# EAGLE design audioDiffPairRev7.0 (EAGLE 9.6.2)
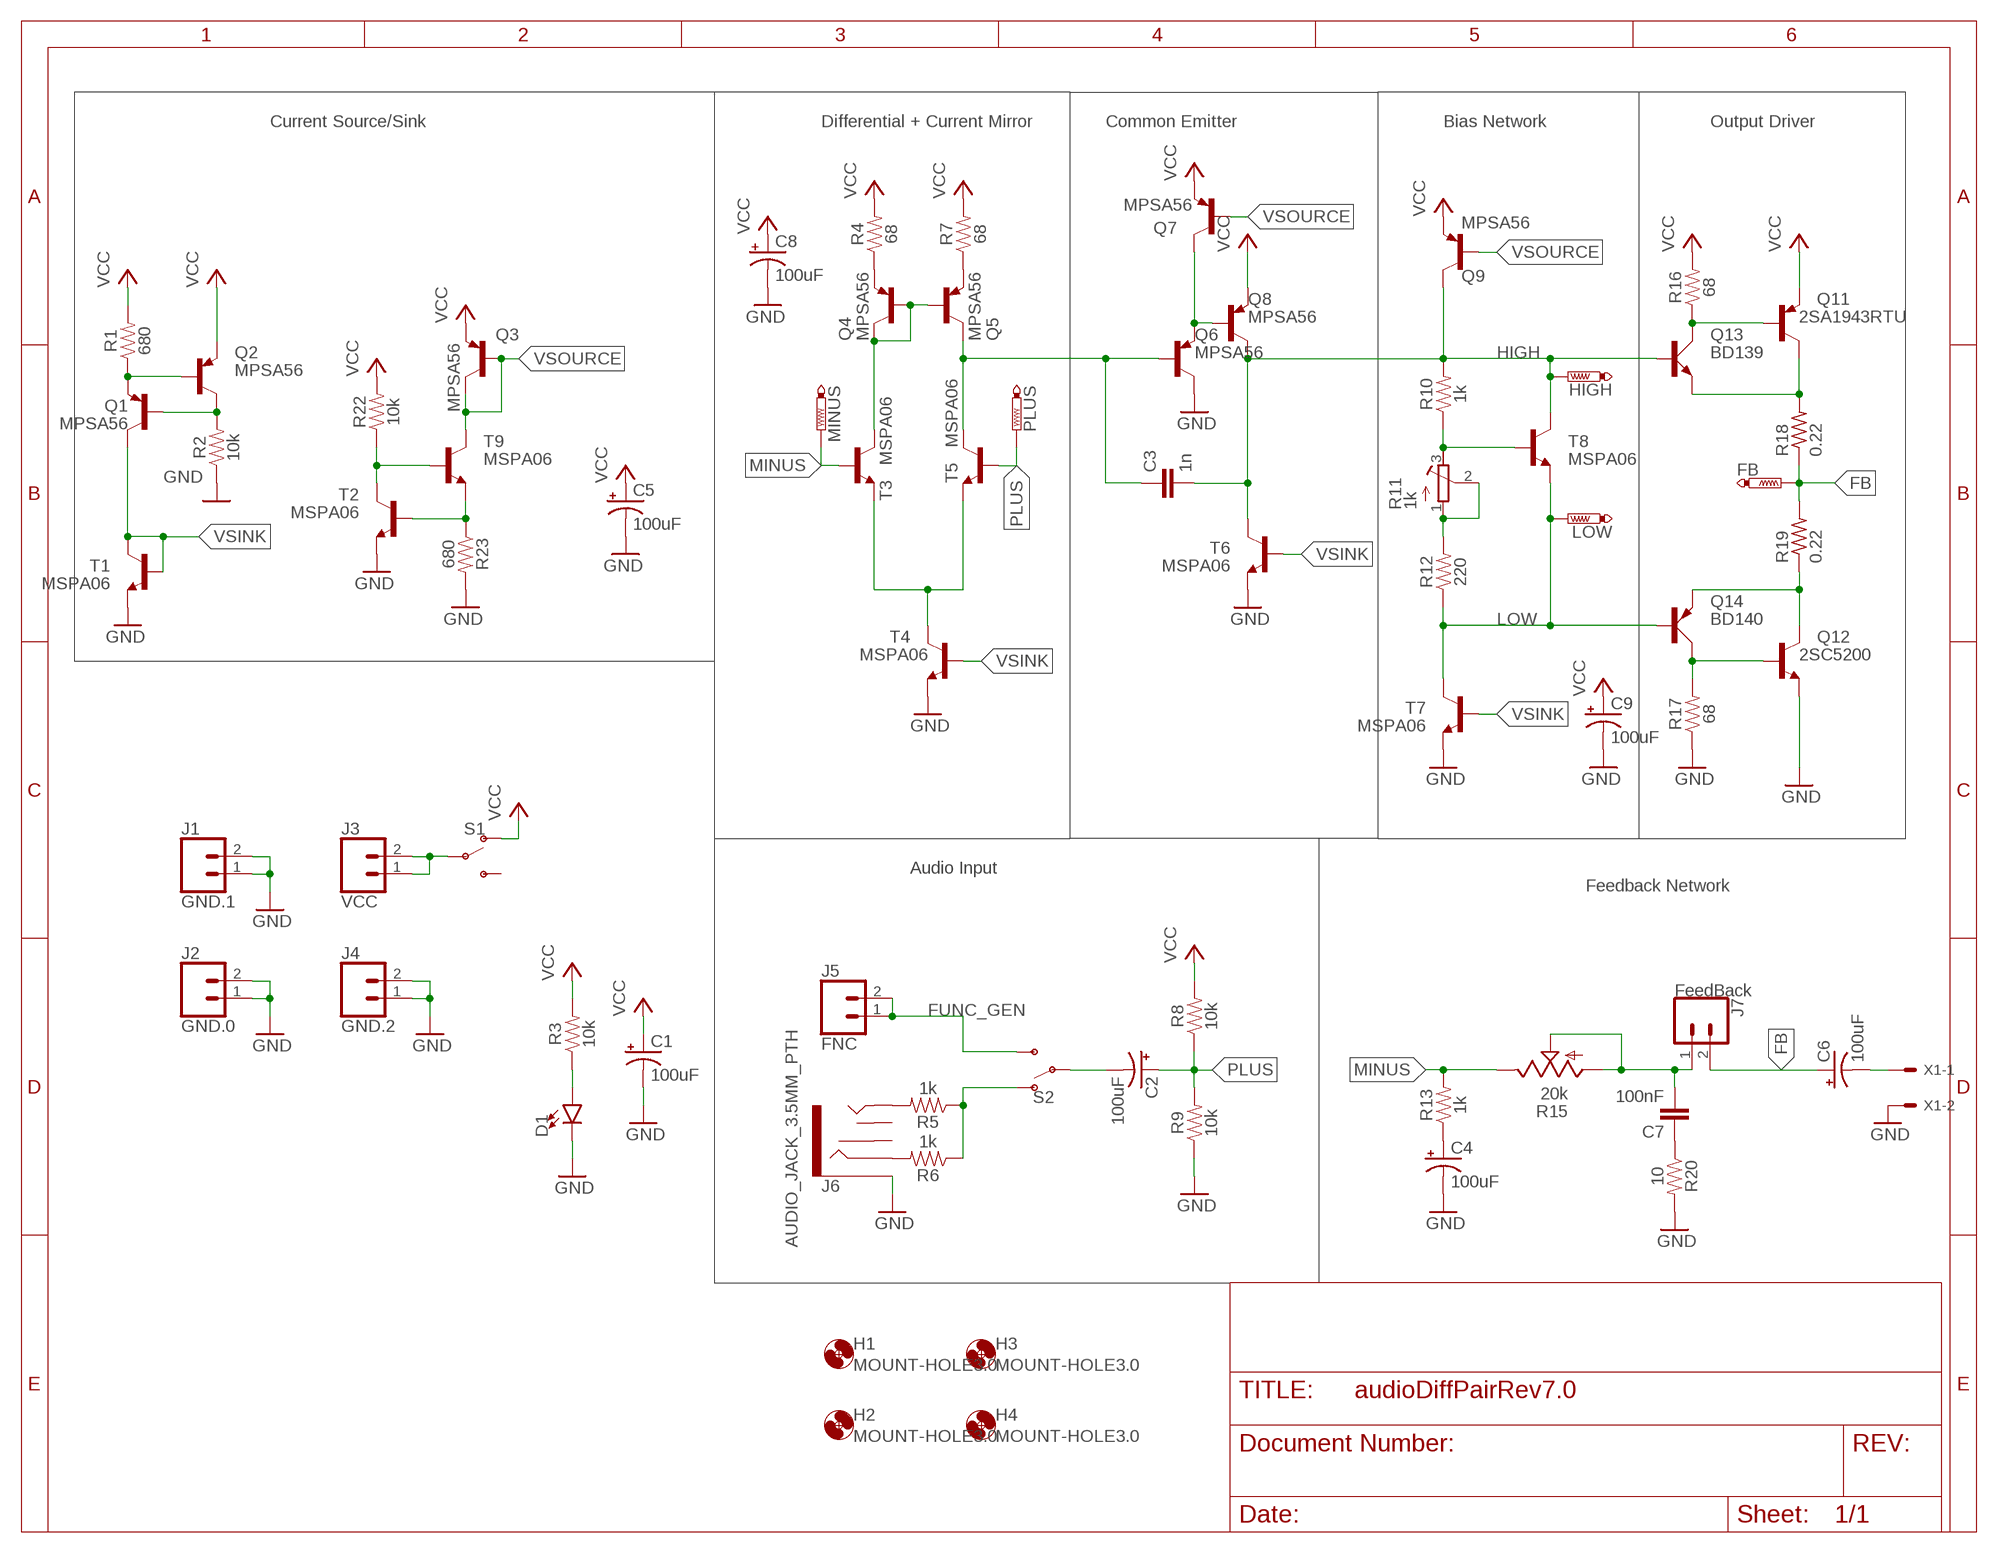
[diagram p0: schematic, sheet 1]

## Parts
C1  100uF  100UF-POLAR-RADIAL-2.5MM-25V-20%  [CPOL-RADIAL-2.5MM-6.5MM]
C2  100uF  100UF-POLAR-RADIAL-2.5MM-25V-20%  [CPOL-RADIAL-2.5MM-6.5MM]
C3  1n  C-EU025-025X050  [C025-025X050]
C4  100uF  100UF-POLAR-RADIAL-2.5MM-25V-20%  [CPOL-RADIAL-2.5MM-6.5MM]
C5  100uF  100UF-POLAR-RADIAL-2.5MM-25V-20%  [CPOL-RADIAL-2.5MM-6.5MM]
C6  100uF  100UF-POLAR-RADIAL-2.5MM-25V-20%  [CPOL-RADIAL-2.5MM-6.5MM]
C7  100nF  C-EU025-025X050  [C025-025X050]
C8  100uF  100UF-POLAR-RADIAL-2.5MM-25V-20%  [CPOL-RADIAL-2.5MM-6.5MM]
C9  100uF  100UF-POLAR-RADIAL-2.5MM-25V-20%  [CPOL-RADIAL-2.5MM-6.5MM]
D1  LED5MM  [LED_5MM]
FB  PTR1PAD1-13Y  [P1-13Y]
H1  MOUNT-HOLE3.0  [3,0]
H2  MOUNT-HOLE3.0  [3,0]
H3  MOUNT-HOLE3.0  [3,0]
H4  MOUNT-HOLE3.0  [3,0]
HIGH  PTR1PAD1-13Y  [P1-13Y]
J1  GND.1  CONN_02LOCK_LONGPADS  [1X02_LOCK_LONGPADS]
J2  GND.0  CONN_02LOCK_LONGPADS  [1X02_LOCK_LONGPADS]
J3  VCC  CONN_02LOCK_LONGPADS  [1X02_LOCK_LONGPADS]
J4  GND.2  CONN_02LOCK_LONGPADS  [1X02_LOCK_LONGPADS]
J5  FNC  CONN_02LOCK_LONGPADS  [1X02_LOCK_LONGPADS]
J6  AUDIO_JACK_3.5MM_PTH  [AUDIO-JACK]
J7  FeedBack  CONN_02LOCK_LONGPADS  [1X02_LOCK_LONGPADS]
LOW  PTR1PAD1-13Y  [P1-13Y]
MINUS  PTR1PAD1-13Y  [P1-13Y]
PLUS  PTR1PAD1-13Y  [P1-13Y]
Q1  MPSA56  [TO92-CBE]
Q2  MPSA56  [TO92-CBE]
Q3  MPSA56  [TO92-CBE]
Q4  MPSA56  [TO92-CBE]
Q5  MPSA56  [TO92-CBE]
Q6  MPSA56  [TO92-CBE]
Q7  MPSA56  [TO92-CBE]
Q8  MPSA56  [TO92-CBE]
Q9  MPSA56  [TO92-CBE]
Q11  2SA1943RTU  [TO545P2000X500X2900-3]
Q12  2SC5200  [TO545P2020X520X2910-3]
Q13  BD139  [TO126AV]
Q14  BD140  [TO126AV]
R1  680  RESISTORAXIAL-0.3  [AXIAL-0.3]
R2  10k  RESISTORAXIAL-0.3  [AXIAL-0.3]
R3  10k  RESISTORAXIAL-0.3  [AXIAL-0.3]
R4  68  RESISTORAXIAL-0.3  [AXIAL-0.3]
R5  1k  RESISTORAXIAL-0.3  [AXIAL-0.3]
R6  1k  RESISTORAXIAL-0.3  [AXIAL-0.3]
R7  68  RESISTORAXIAL-0.3  [AXIAL-0.3]
R8  10k  RESISTORAXIAL-0.3  [AXIAL-0.3]
R9  10k  RESISTORAXIAL-0.3  [AXIAL-0.3]
R10  1k  RESISTORAXIAL-0.3  [AXIAL-0.3]
R11  1k  R-TRIMM3296W  [RTRIM3296W]
R12  220  RESISTORAXIAL-0.3  [AXIAL-0.3]
R13  1k  RESISTORAXIAL-0.3  [AXIAL-0.3]
R15  20k  US-EVUF2A  [EVUF]
R16  68  RESISTORAXIAL-0.3  [AXIAL-0.3]
R17  68  RESISTORAXIAL-0.3  [AXIAL-0.3]
R18  0.22  R-US_0411/15  [0411/15]
R19  0.22  R-US_0411/15  [0411/15]
R20  10  RESISTORAXIAL-0.3  [AXIAL-0.3]
R22  10k  RESISTORAXIAL-0.3  [AXIAL-0.3]
R23  680  RESISTORAXIAL-0.3  [AXIAL-0.3]
S1  SWITCH-SPDT-PTH-11.6X4.0MM-LOCK  [SWITCH_SPDT_PTH_11.6X4.0MM_LOCK]
S2  SWITCH-SPDT-PTH-11.6X4.0MM-LOCK  [SWITCH_SPDT_PTH_11.6X4.0MM_LOCK]
T1  MSPA06  MPSA06-NPN-TO92-EBC  [TO92-EBC]
T2  MSPA06  MPSA06-NPN-TO92-EBC  [TO92-EBC]
T3  MSPA06  MPSA06-NPN-TO92-EBC  [TO92-EBC]
T4  MSPA06  MPSA06-NPN-TO92-EBC  [TO92-EBC]
T5  MSPA06  MPSA06-NPN-TO92-EBC  [TO92-EBC]
T6  MSPA06  MPSA06-NPN-TO92-EBC  [TO92-EBC]
T7  MSPA06  MPSA06-NPN-TO92-EBC  [TO92-EBC]
T8  MSPA06  MPSA06-NPN-TO92-EBC  [TO92-EBC]
T9  MSPA06  MPSA06-NPN-TO92-EBC  [TO92-EBC]
X1  KK-156-2  [KK-156-2]

## Nets
FB: C6.1(+) FB.TP J7.2 R18.1 R19.2
FUNC_GEN: J5.1 J5.2 S2.3(S)
GND: C1.2(-) C4.2(-) C5.2(-) C8.2(-) C9.2(-) D1.K(C) J1.1 J1.2 J2.1 J2.2 J4.1 J4.2 J6.SLEEVE Q6.C Q12.3(E) R2.P$1 R9.P$1 R17.P$1 R20.P$2 R23.P$2 T1.E T2.E T4.E T6.E T7.E X1.2
HIGH: C3.2 HIGH.TP Q8.C Q9.C Q13.B R10.P$2 T6.C T8.C
HIGH1: Q6.E Q7.C Q8.B
LOW: LOW.TP Q14.B R12.P$1 T7.C T8.E
MINUS: MINUS.TP R13.P$2 R15.3(E) T3.B
N$1: Q1.E Q2.B R1.P$1
N$2: Q1.B Q2.C R2.P$2
N$3: Q4.B Q4.C Q5.B T3.C
N$4: C3.1 Q5.C Q6.B T5.C
N$5: C7.1 R20.P$1
N$6: C7.2 J7.1 R15.1(A) R15.2(S)
N$8: Q4.E R4.P$1
N$9: Q5.E R7.P$1
N$10: D1.A R3.P$1
N$11: Q11.1(B) Q13.C R16.P$1
N$12: J3.1 J3.2 S1.2(P)
N$13: J6.RING R6.P$2
N$14: R22.P$1 T2.C T9.B
N$15: C2.2(-) S2.2(P)
N$16: T3.E T4.C T5.E
N$18: Q12.1(B) Q14.C R17.P$2
N$19: Q12.2(C) Q14.E R19.1
N$20: C4.1(+) R13.P$1
N$21: R23.P$1 T2.B T9.E
N$22: J6.TIP R5.P$2
N$23: R5.P$1 R6.P$1 S2.1(O)
N$25: C6.2(-) X1.1
N$27: Q11.2(C) Q13.E R18.2
N$28: R10.P$1 R11.3(E) T8.B
N$29: R11.1(A) R11.2(S) R12.P$2
PLUS: C2.1(+) PLUS.TP R8.P$1 R9.P$2 T5.B
VCC: C1.1(+) C5.1(+) C8.1(+) C9.1(+) Q2.E Q3.E Q7.E Q8.E Q9.E Q11.3(E) R1.P$2 R3.P$2 R4.P$2 R7.P$2 R8.P$2 R16.P$2 R22.P$2 S1.1(O)
VSINK: Q1.C T1.B T1.C T4.B T6.B T7.B
VSOURCE: Q3.B Q3.C Q7.B Q9.B T9.C
Unconnected: J6.RSH J6.TSH S1.3(S)

## Notes on the sheet
- Current Source/Sink | Differential + Current Mirror | Common Emitter | Bias Network | Output Driver
- Audio Input
- Feedback Network

## Library data of the parts
C1 C2 C4-C6 C8 C9 = SparkFun-Capacitors:100UF-POLAR: 100µF polarized capacitors A capacitor is a passive two-terminal electrical component used to store electrical energy temporarily in an electric field.; PROD_ID: CAP-08439
C3 C7 = rcl:C-EU: CAPACITOR, European symbol; SPICEPREFIX: C
D1 = SparkFun-LED:LED: LED (Generic) Standard schematic elements and footprints for 5mm, 3mm, 1206, and 0603 sized LEDs. Generic LEDs with no color specified.
FB HIGH LOW MINUS PLUS = testpad:PTR1: TEST PIN
H1-H4 = holes:MOUNT-HOLE: MOUNTING HOLE with drill center marker
J1-J5 J7 = SparkFun-Connectors:CONN_02: Multi connection point. Often used as Generic Header-pin footprint for 0.1 inch spaced/style header connections On any of the 0.1 inch spaced packages, you can populate with these: Break Away Headers - Straight <https://www.sparkfun.com/products/116> (PRT-00116) Break Away Male Headers - Right Angle <https://www.sparkfun.com/products/553> (PRT-00553) Female Headers <https://www.sparkfun.com/products/115> (PRT-00115) Break Away Headers - Machine Pin <https://www.sparkfun.com/products/117> (PRT-00117) Break Away Female Headers - Swiss Machine Pin <https://www.sparkfun.com/products/743> (PRT-00743) For SCREWTERMINALS and SPRING TERMINALS visit here: Screw Terimnals on SparkFun.com <https://www.sparkfun.com/search/results?term=Screw+Terminals> (5mm/3.5mm/2.54mm spacing) This device is also useful as a general connection point to wire up your design to another part of your project. Our various solder wires solder well into these plated through hole pads. Hook-Up Wire - Assortment (Stranded, 22 AWG) <https://www.sparkfun.com/products/11375> (PRT-11375) Hook-Up Wire - Assortment (Solid Core, 22 AWG) <https://www.sparkfun.com/products/11367> (PRT-11367) View the entire wire category on our website here <https://www.sparkfun.com/categories/141> Special notes: Molex polarized connector foot print use with: PRT-08233 with associated crimp pins and housings. 2.54_SCREWTERM for use with PRT-10571. 3.5mm Screw Terminal footprints for PRT-08084 5mm Screw Terminal footprints for use with PRT-08432
J6 = SparkFun-Connectors:AUDIO_JACK_3.5MM: Audio Jack 3.5mm variants of PTH and SMT stereo audio jack with bypass switches. SparkFun Products: SparkFun SparkPunk Sound Kit <[https://www.sparkfun.com/products/11177]> - PTH MP3 Trigger <https://www.sparkfun.com/products/13720> -3.5mm SMD SparkFun PicoBoard <https://www.sparkfun.com/products/11888>- 2.5mm SMD; PROD_ID: CONN-08774; SF_ID: PRT-08032
Q1-Q9 = transistor-pnp:MPSA56*: PNP Transistror Source: http://www.fairchildsemi.com/ds/MM/MMBTA56.pdf
Q11 = 2SA1943RTU:2SA1943RTU; MANUFACTURER: Onsemi; MAXIMUM_PACKAGE_HEIGHT: 29 mm; PARTREV: C; STANDARD: IPC 7351B
Q12 = 2SC5200:2SC5200; AVAILABILITY: Unavailable; DESCRIPTION: 2SC5200 Series NPN 230 V 15 A Epitaxial Planar Bipolar Transistor - TO-264; MANUFACTURER: STMicroelectronics; MP: 2SC5200; PACKAGE: TO-264-3 STMicroelectronics; PARTREV: 1; PRICE: None; STANDARD: IPC-7251
Q13 = transistor-power:BD139: NPN TRANSISTOR
Q14 = transistor-power:BD140: PNP TRANSISTOR
R1-R10 R12 R13 R16 R17 R20 R22 R23 = SparkFun-Resistors:RESISTOR: Generic Resistor Package
R11 = resistor:R-TRIMM: Trimm resistor
R15 = pot:US-EVU: 9 mm Square Rotary Potentiometers Source: Panasonic
R18 R19 = rcl:R-US_: RESISTOR, American symbol; SPICEPREFIX: R
S1 S2 = SparkFun-Switches:SWITCH-SPDT: Single Pole, Double Throw (SPDT) Switch Single-pole, double-throw (SPDT) switch. Variant Overview SMD-AYZ0202 Surface Mount DPDT Switch <https://www.sparkfun.com/products/597> (COM-00597) Used on e.g. LilyPad Arduino USB - ATmega32U4 Board <https://www.sparkfun.com/products/12049> PTH-11.6X4.0MM SPDT Mini Power Switch <https://www.sparkfun.com/products/102> (COM-00102) Used on e.g. SparkFun Simon Says - Through-Hole Soldering Kit <https://www.sparkfun.com/products/10547> (KIT-10547) PTH-11.6X4.0MM-KIT KIT version of SPDT Mini Power Switch - Simplifies soldering by removing tStop of switch pins - only one side can be soldered. PTH-11.6X4.0MM-LOCK LOCK version of SPDT Mini Power Switch - Offset pins hold switch in place for easier soldering. SMD-RIGHT-ANGLE Surface Mount Right Angle Switch <https://www.sparkfun.com/products/10860> (COM-10860) Used on e.g. SparkFun ESP8266 Thing <https://www.sparkfun.com/products/13231>; PROD_ID: SWCH-08261; SF_SKU: COM-00102
T1-T9 = transistor:*-NPN-: NPN Transistror BF959 corrected 2008.03.06
X1 = con-molex:KK-156-2: KK 156 HEADER Source: http://www.molex.com/pdm_docs/sd/026604100_sd.pdf; MF: MOLEX; OC_FARNELL: unknown; OC_NEWARK: unknown

## Board
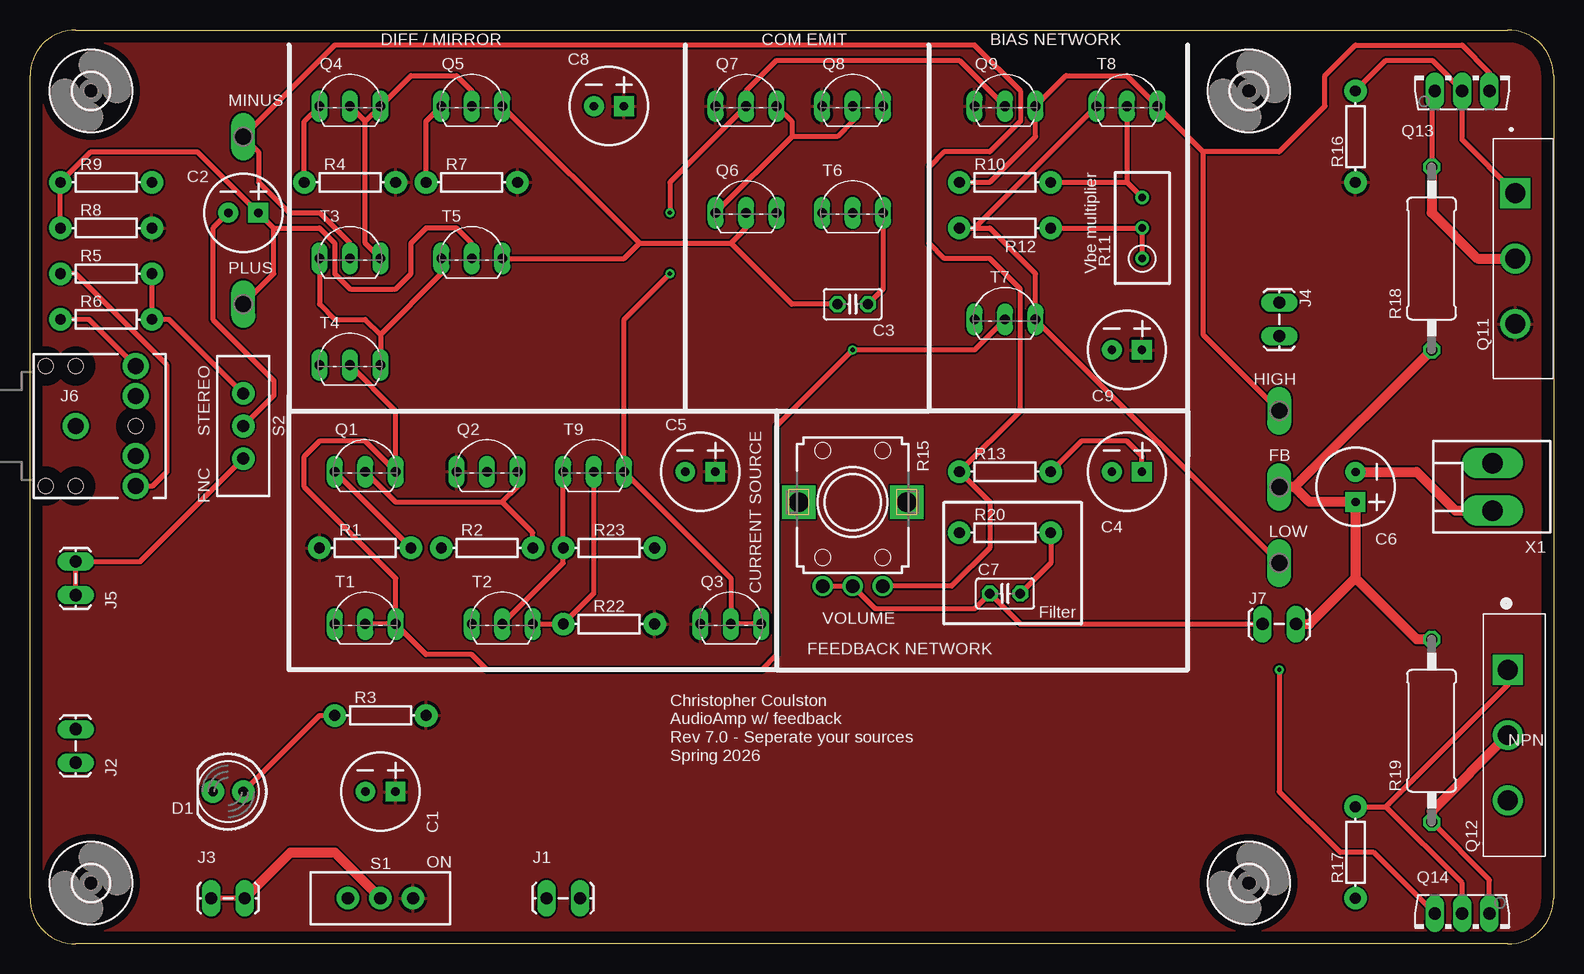
[diagram p1: board, top side]
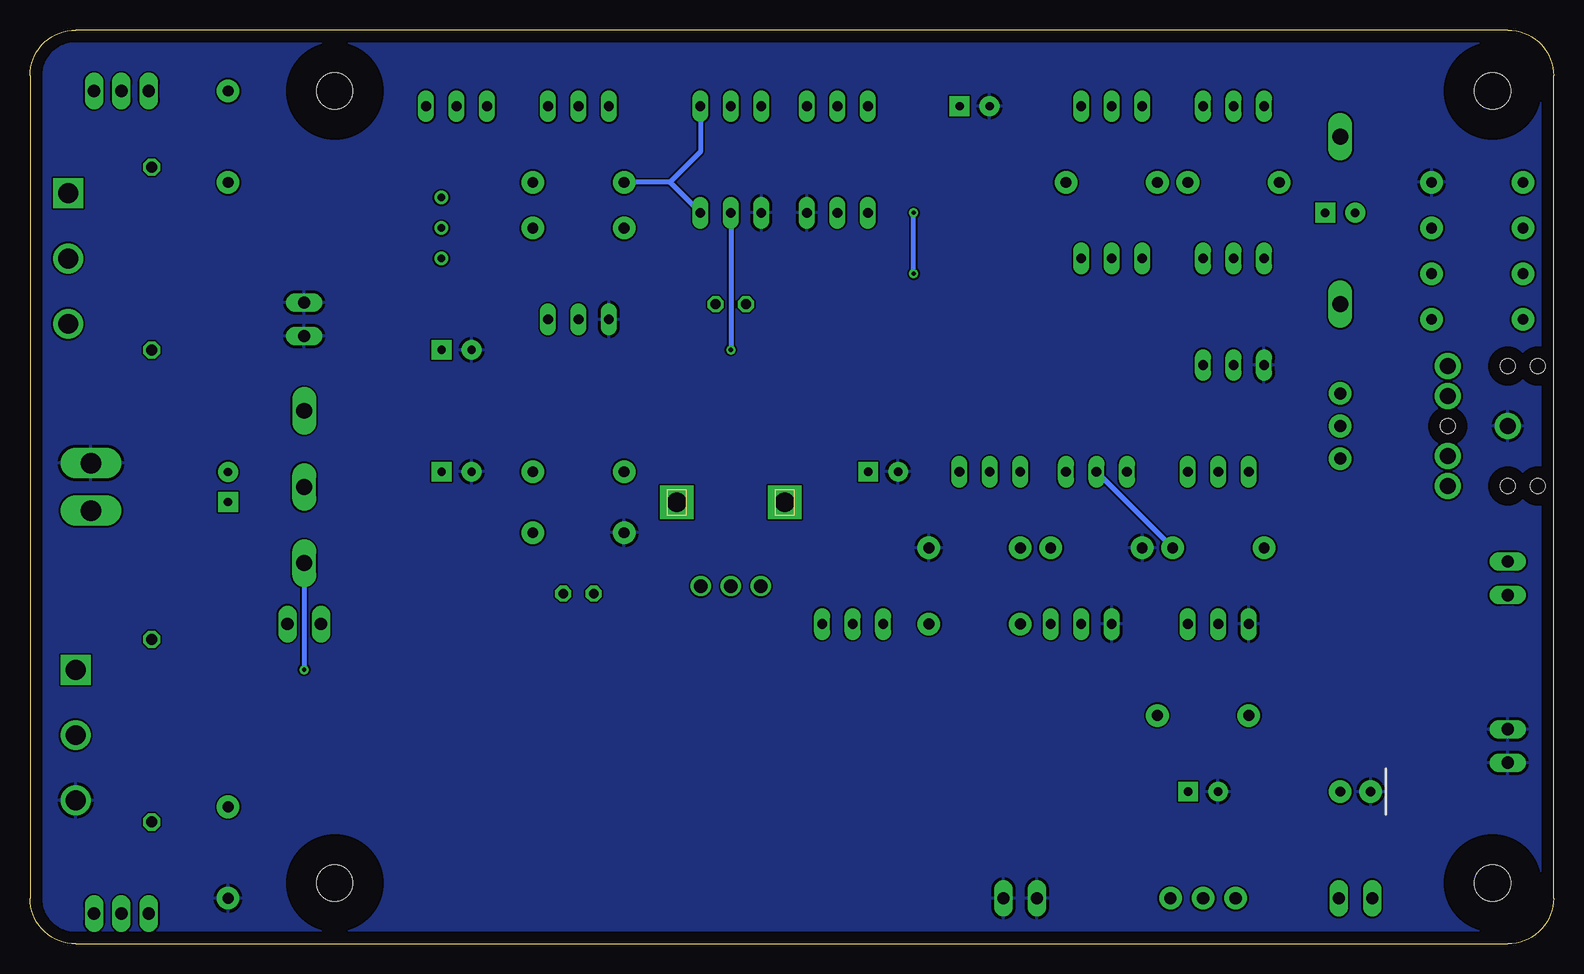
[diagram p2: board, bottom side, seen from below]

Size 127 x 76.2 mm. Coordinates in mm from the lower left corner, seen from the top.
Outline: 3.81,76.2 123.19,76.2 arc-90 127,72.39 127,3.81 arc-90 123.19,0 3.81,0 arc-90 0,3.81 0,72.39 arc-90 3.81,76.2
Copper layers (1*16): Top 0.035mm / dielectric 1.5mm / Bottom 0.035mm
Design rules "default": minimum track width 6mil, minimum drill 0.35mm, track to track 6mil, track to pad 6mil, pad to pad 6mil, via to via 6mil, smd to smd 6mil, copper to edge 40mil, drill to drill 6mil, minimum pad ring 10mil, minimum via ring 8mil, stop-mask expansion 4mil, vias tented up to drill 0mil, thermal gap 10mil

### Footprints (pad centres in the part's own frame; a part is rotated, then mirrored left to right if it is on the bottom)
CPOL-RADIAL-2.5MM-6.5MM = drill 0.7 pad 1.651 square: 1 1.25,0 | drill 0.7 pad 1.651: 2 -1.25,0
C025-025X050 = drill 0.813 octagon: 1 -1.27,0; 2 1.27,0
LED_5MM = drill 0.813 pad 1.88: A -1.27,0; K 1.27,0
P1-13Y = drill 1.321 pad 1.905 long: TP 0,0
3,0 = hole 3: 0,0
1X02_LOCK_LONGPADS = drill 1.016 long: 1 -0.127,0; 2 2.667,0
AUDIO-JACK = drill 1.3 pad 2.184: RING 5,5; RSH 5,2.5; SLEEVE 0,0; TIP 5,-5; TSH 5,-2.5 | hole 1.2: 0,5; -2.5,5; -2.5,-5; 0,-5; 5,0
TO92-CBE = drill 0.813 long: B 0,0; C 2.54,0; E -2.54,0
TO545P2000X500X2900-3 = drill 1.66 square: 1 -5.45,-0.637 | drill 1.66: 2 0,-0.637; 3 5.45,-0.637
TO545P2020X520X2910-3 = drill 1.66 square: 1 0,0 | drill 1.66: 2 5.45,0; 3 10.9,0
TO126AV = drill 1.016 long: B 2.286,-1.27; C 0,-1.27; E -2.286,-1.27
AXIAL-0.3 = drill 0.9 pad 1.88: P$1 -3.81,0; P$2 3.81,0
RTRIM3296W = drill 0.61: 1 0,-2.54; 2 0,0; 3 0,2.54
EVUF = drill 1.1 pad 1.676: 1 -2.5,-7; 2 0,-7; 3 2.5,-7 | drill 1.6 pad 2.8 square: M1 4.5,0; M2 -4.5,0
0411/15 = drill 0.914 octagon: 1 -7.62,0; 2 7.62,0
SWITCH_SPDT_PTH_11.6X4.0MM_LOCK = drill 1.016 pad 1.88: 1 0,2.718; 2 0,0; 3 0,-2.718
TO92-EBC = drill 0.813 long: B 0,-1.27; C 2.54,-1.27; E -2.54,-1.27
KK-156-2 = drill 1.7 pad 2.184 long: 1 -1.98,0; 2 1.98,0

### Placement (x,y rotation side)
C1  29.21,12.7 0 top
C2  17.78,60.96 0 top
C3  68.58,53.34 0 top
C4  91.44,39.37 0 top
C5  55.88,39.37 0 top
C6  110.49,38.1 270 top
C7  81.28,29.21 180 top
C8  48.26,69.85 0 top
C9  91.44,49.53 0 top
D1  16.51,12.7 180 top
FB  104.14,38.1 0 top
H1  101.6,5.08 0 top
H2  5.08,5.08 0 top
H3  101.6,71.12 0 top
H4  5.08,71.12 0 top
HIGH  104.14,44.45 180 top
J1  45.72,3.81 180 top
J2  3.81,17.78 270 top
J3  15.24,3.81 0 top
J4  104.14,53.34 270 top
J5  3.81,31.75 270 top
J6  3.81,43.18 0 top
J7  102.87,26.67 0 top
LOW  104.14,31.75 0 top
MINUS  17.78,67.31 0 top
PLUS  17.78,53.34 0 top
Q1  27.94,39.37 0 top
Q2  38.1,39.37 0 top
Q3  58.42,26.67 0 top
Q4  26.67,69.85 0 top
Q5  36.83,69.85 0 top
Q6  59.69,60.96 0 top
Q7  59.69,69.85 0 top
Q8  68.58,69.85 0 top
Q9  81.28,69.85 0 top
Q11  124.46,57.15 270 top
Q12  123.19,22.86 270 top
Q13  119.38,72.39 0 top
Q14  119.38,1.27 180 top
R1  27.94,33.02 180 top
R2  38.1,33.02 0 top
R3  29.21,19.05 0 top
R4  26.67,63.5 0 top
R5  6.35,55.88 180 top
R6  6.35,52.07 180 top
R7  36.83,63.5 0 top
R8  6.35,59.69 0 top
R9  6.35,63.5 180 top
R10  81.28,63.5 180 top
R11  92.71,59.69 0 top
R12  81.28,59.69 0 top
R13  81.28,39.37 180 top
R15  68.58,36.83 0 top
R16  110.49,67.31 270 top
R17  110.49,7.62 90 top
R18  116.84,57.15 90 top
R19  116.84,17.78 90 top
R20  81.28,34.29 180 top
R22  48.26,26.67 0 top
R23  48.26,33.02 0 top
S1  29.21,3.81 270 top
S2  17.78,43.18 0 top
T1  27.94,27.94 0 top
T2  39.37,27.94 0 top
T3  26.67,58.42 0 top
T4  26.67,49.53 0 top
T5  36.83,58.42 0 top
T6  68.58,62.23 0 top
T7  81.28,53.34 0 top
T8  91.44,71.12 0 top
T9  46.99,40.64 0 top
X1  121.92,38.1 90 top

### Tracks (layer width: path | path; a pad name or v marks a point on that pad's centre or on a via)
FB
  Top 0.813: 110.49,30.5 106.66,26.67 J7.2 | 110.49,30.5 C6.1 106.66,36.85 105.41,38.1 | R19.2 115.59,25.4 110.49,30.5 | R18.1 105.41,38.1 | 105.41,38.1 FB.TP
FUNC_GEN
  Top 0.406: J5.2 J5.1 9.2,31.88 S2.3
GND
  pour Bottom (rank 2): 123.19,76.2 3.81,76.2 arc90 0,72.39 0,3.81 arc90 3.81,0 123.19,0 arc90 127,3.81 127,72.39 arc90
HIGH
  Top 0.406: T6.C 71.12,54.61 C3.2 | R10.P$2 80.01,63.5 83.82,67.31 Q9.C 86.36,72.39 91.44,72.39 T8.C 97.79,66.04 | Q13.B 121.67,72.64 119.38,74.93 110.49,74.93 107.95,72.39 107.95,69.85 104.14,66.04 97.79,66.04 | HIGH.TP 97.79,50.8 97.79,66.04
  Bottom 0.406: T6.C 73.66,63.5 | 73.66,63.5 R10.P$2 | Q8.C 71.12,66.04 73.66,63.5
HIGH1
  Top 0.406: Q8.B 68.58,68.58 67.31,67.31 63.5,67.31 | 63.5,67.31 Q6.E | Q7.C 63.5,68.58 63.5,67.31
LOW  (via drill 0.35)
  Top 0.406: Q14.B 112.01,7.62 109.22,7.62 104.14,12.7 v104.14,22.86 | T8.E 78.74,59.69 R12.P$1 80.01,59.69 83.82,55.88 T7.C LOW.TP
  Bottom 0.406: LOW.TP v104.14,22.86
MINUS
  Top 0.406: R15.3 76.82,29.83 80.01,33.02 80.01,36.83 R13.P$2 82.55,44.45 82.55,54.61 80.01,57.15 76.2,57.15 74.93,58.42 74.93,64.77 76.2,66.04 80.01,66.04 82.55,68.58 82.55,71.12 78.74,74.93 25.4,74.93 MINUS.TP 19.05,66.04 19.05,63.5 21.59,60.96 24.13,60.96 26.67,58.42 T3.B
N$1
  Top 0.406: R1.P$1 Q1.E
  Bottom 0.406: R1.P$1 Q2.B
N$2
  Top 0.406: Q1.B 30.48,36.83 39.37,36.83 | 39.37,36.83 40.64,38.1 Q2.C | R2.P$2 41.91,34.29 39.37,36.83
N$3
  Top 0.406: Q5.B 36.83,71.12 35.56,72.39 31.75,72.39 Q4.C 27.94,68.58 | T3.C 27.94,58.42 27.94,68.58 | 27.94,68.58 Q4.B
N$4
  Top 0.406: 58.42,58.42 59.69,59.69 Q6.B | C3.1 63.5,53.34 58.42,58.42 | Q5.C 50.8,58.42 | 50.8,58.42 58.42,58.42 | T5.C 49.53,57.15 50.8,58.42
N$5
  Top 0.406: R20.P$1 85.09,31.75 C7.1
N$6
  Top 0.406: R15.1 R15.2 70.47,27.94 78.74,27.94 C7.2 82.55,26.67 J7.1
N$8
  Top 0.406: Q4.E 22.86,68.58 R4.P$1
N$9
  Top 0.406: R7.P$1 33.02,68.58 Q5.E
N$10
  Top 0.406: D1.A 24.13,19.05 R3.P$1
N$11
  Top 0.406: Q11.1 119.38,67.04 Q13.C 118.21,72.29 118.21,72.34 116.9,73.66 113.03,73.66 R16.P$1
N$12
  Top 0.406: J3.2 J3.1
  Top 0.813: J3.2 21.72,7.62 25.4,7.62 S1.2
N$13
  Top 0.406: J6.RING 4.92,52.07 R6.P$2
N$14
  Top 0.406: T2.C R22.P$1 46.99,29.21 T9.B
N$15
  Top 0.406: S2.2 20.32,45.72 20.32,46.99 15.24,52.07 15.24,59.67 C2.2
N$16
  Top 0.406: T3.E 24.13,53.34 25.4,52.07 27.94,52.07 29.21,50.8 | 29.21,50.8 T4.C | T5.E 34.29,55.88 29.21,50.8
N$18
  Top 0.406: Q14.C 119.38,5.08 113.03,11.43 | R17.P$2 113.03,11.43 | 113.03,11.43 123.19,21.59 Q12.1
N$19
  Top 0.406: Q14.E 121.67,5.33 R19.1
  Top 0.813: Q12.2 116.84,11.06 R19.1
N$20
  Top 0.406: C4.1 92.69,40.66 91.44,41.91 87.63,41.91 R13.P$1
N$21
  Top 0.406: T9.E R23.P$1 44.45,31.75 T2.B
N$22
  Top 0.406: R5.P$2 3.81,55.88 11.43,48.26 11.43,39.37 10.24,38.18 J6.TIP
N$23
  Top 0.406: R5.P$1 R6.P$1 11.61,52.07 S2.1
N$25
  Top 0.813: C6.2 115.59,39.35 118.82,36.12 X1.1
N$27
  Top 0.406: Q13.E 116.84,70.87 R18.2
  Top 0.813: R18.2 116.84,60.96 120.65,57.15 Q11.2
N$28
  Top 0.406: R10.P$1 91.44,63.5 | 91.44,63.5 R11.3 | T8.B 91.44,63.5
N$29
  Top 0.406: R12.P$2 R11.2 R11.1
PLUS
  Top 0.406: R8.P$1 R9.P$2 5.08,66.04 13.95,66.04 C2.1 20.32,59.67 | 20.32,59.67 24.11,59.67 24.13,59.69 25.4,58.42 25.4,55.88 26.67,54.61 30.48,54.61 31.75,55.88 31.75,58.42 33.02,59.69 35.56,59.69 36.83,58.42 T5.B | PLUS.TP 20.32,55.88 20.32,59.67
VCC
  pour Top (rank 2): 123.19,76.2 3.81,76.2 arc90 0,72.39 0,3.81 arc90 3.81,0 123.19,0 arc90 127,3.81 127,72.39 arc90
VSINK  (via drill 0.35)
  Top 0.406: T1.C T1.B | T1.C 30.48,30.48 22.86,38.1 22.86,40.64 24.13,41.91 27.94,41.91 Q1.C 30.48,44.45 T4.B | T1.C 33.02,24.13 36.83,24.13 38.1,22.86 60.96,22.86 62.23,24.13 62.23,43.18 v68.58,49.53 78.74,49.53 T7.B
  Bottom 0.406: T6.B v68.58,49.53
VSOURCE  (via drill 0.35)
  Top 0.406: Q9.B 77.47,73.66 62.23,73.66 59.69,71.12 Q7.B 53.34,63.5 v53.34,60.96 | Q3.C Q3.B 58.42,30.48 T9.C 49.53,52.07 v53.34,55.88
  Bottom 0.406: v53.34,55.88 v53.34,60.96

### Text on the board
tPlace: DIFF / MIRROR | COM EMIT | BIAS NETWORK | Vbe multiplier | FNC STEREO | CURRENT SOURCE | VOLUME | Filter | FEEDBACK NETWORK | NPN | Christopher Coulston / AudioAmp w/ feedback / Rev 7.0 - Seperate your sources / Spring 2026 | ON